# Altium schematic sheet ADC.SchDoc: ESP32 - ANALOG BOARD
size A2; Author: Luca Schenetti; DrawnBy: Luca Schenetti; Revision: B; SheetNumber: 5; SheetTotal: 5
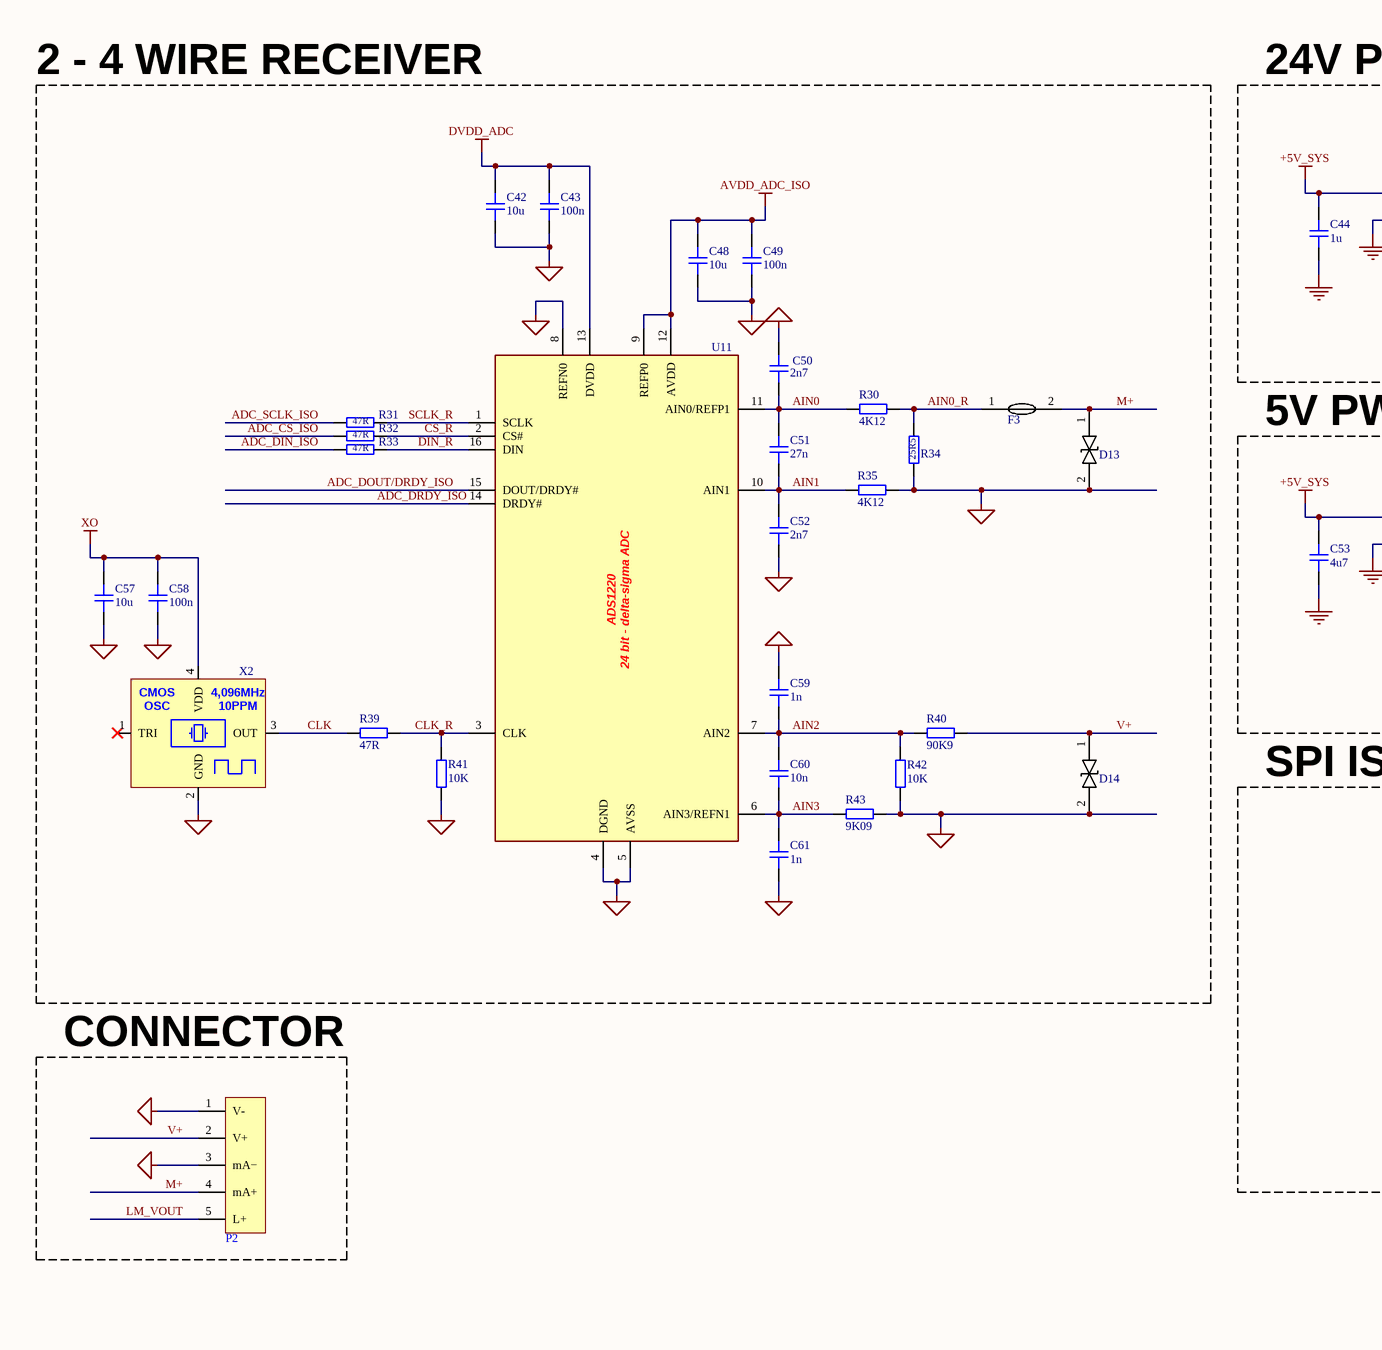
[diagram p0: ADC.SchDoc, left]
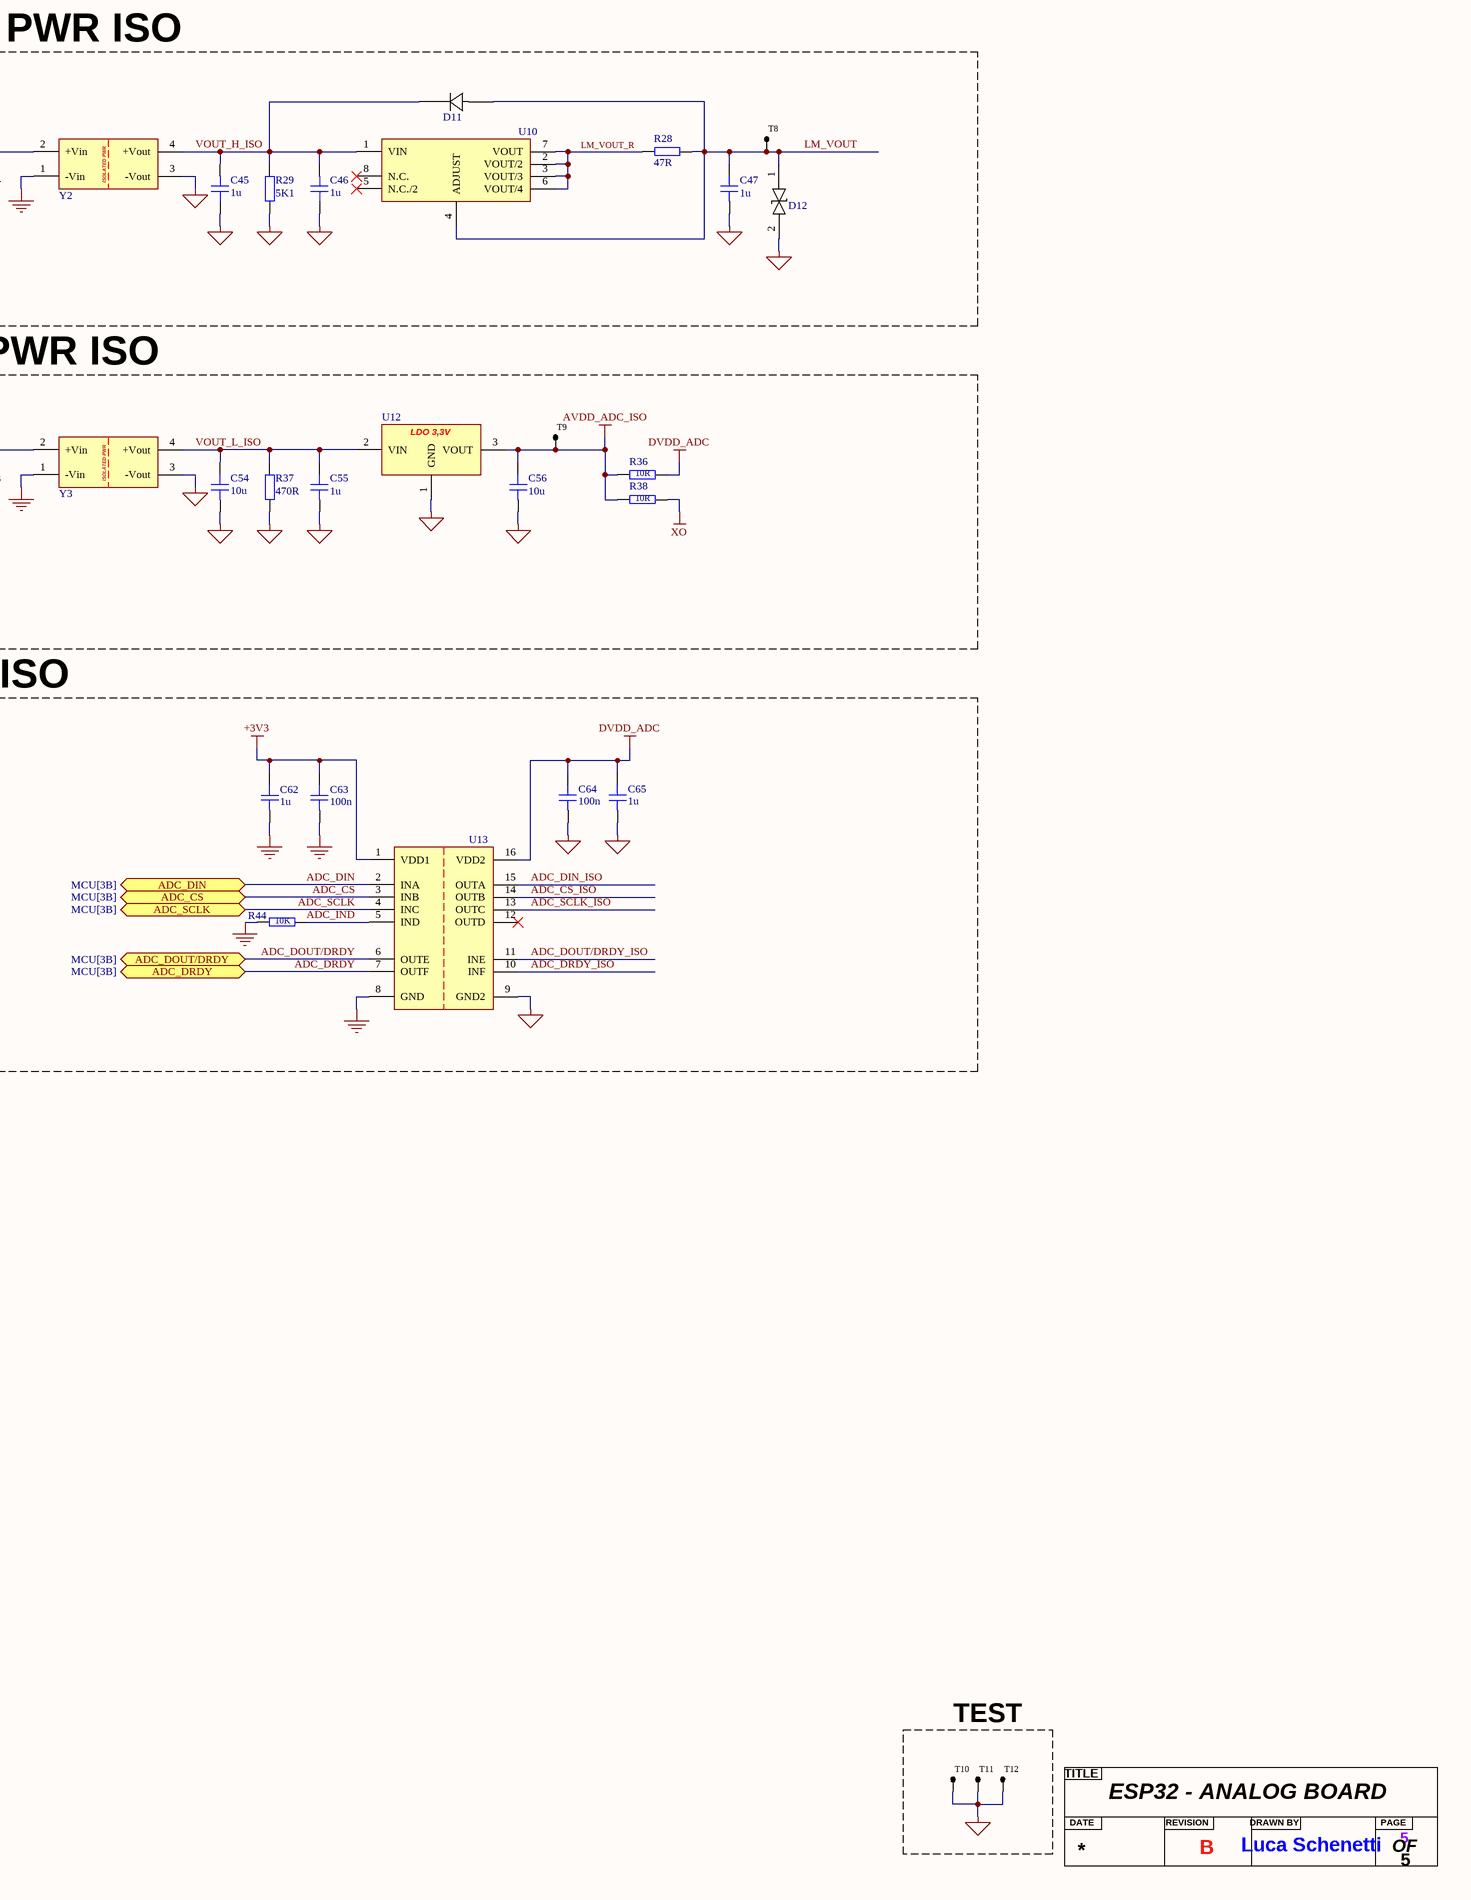
[diagram p1: ADC.SchDoc, right]

## Parts
?  Title  (value not drawn)  (graphical)
C42  10u  [CAP_0402]
C43  100n  [CAP_0402]
C44  1u  [CAP_0805]
C45  1u  [CAP_0805]
C46  1u  [CAP_0805]
C47  1u  [CAP_0805]
C48  10u  [CAP_0402]
C49  100n  [CAP_0402]
C50  2n7  [CAP_0402]
C51  27n  [CAP_0402]
C52  2n7  [CAP_0402]
C53  4u7  [CAP_0805]
C54  10u  [CAP_0805]
C55  1u  [CAP_0603]
C56  10u  [CAP_0603]
C57  10u  [CAP_0402]
C58  100n  [CAP_0402]
C59  1n  [CAP_0402]
C60  10n  [CAP_0402]
C61  1n  [CAP_0402]
C62  1u  [CAP_0402]
C63  100n  [CAP_0402]
C64  100n  [CAP_0402]
C65  1u  [CAP_0402]
D11  DIODE 300mA 75V  [1N4148W]  (value not drawn)
D12  BIDI TVS 36V  [SMAJ33CA]  (value not drawn)
D13  BIDI TVS 36V  [SMAJ33CA]  (value not drawn)
D14  BIDI TVS 36V  [SMAJ33CA]  (value not drawn)
F3  RESETTABLE FUSE 100mA  [BSMD1812-010-60V]  (value not drawn)
P2  WJ500V-5.08-5P  [WJ500V-5.08-5P]  (value not drawn)
R28  47R  [RES_0603]
R29  5K1  [RES_2010]
R30  4K12  [RES_0603]
R31  47R  [RES_0402]
R32  47R  [RES_0402]
R33  47R  [RES_0402]
R34  25R5  [RES_2512]
R35  4K12  [RES_0603]
R36  10R  [RES_0402]
R37  470R  [RES_2010]
R38  10R  [RES_0402]
R39  47R  [RES_0402]
R40  90K9  [RES_0603]
R41  10K  [RES_0402]
R42  10K  [RES_0603]
R43  9K09  [RES_0603]
R44  10K  [RES_0402]
T8  TP_S  [TP 1mm]  (value not drawn)  (no BOM)
T9  TP_S  [TP 1mm]  (value not drawn)  (no BOM)
T10  TP_S  [TP 1mm]  (value not drawn)  (no BOM)
T11  TP_S  [TP 1mm]  (value not drawn)  (no BOM)
T12  TP_S  [TP 1mm]  (value not drawn)  (no BOM)
U10  LDO 100mA 2,2-37V  [LM317LDR2G]  (value not drawn)
U11  ADC 24-Bit 4-Channel  [ADS1220IPWR]  (value not drawn)
U12  LDO 3,3V 250mA  [HT7333-A]  (value not drawn)
U13  Digital Isolators 4 IN - 2 OUT  [NSI8262W1-DSWR]  (value not drawn)
X2  4.096MHz CMOS ±10ppm ±20ppm  [OT32254.096MJBA4SL]  (value not drawn)
Y2  Isolated Power IN 4.5V~5.5V OUT 24V  [B0524S-1WR3]  (value not drawn)
Y3  Isolated Power 21.6V~26.4V  [B0505S-1WR3]  (value not drawn)

## Blocks framed on the sheet
2 - 4 WIRE RECEIVER: C42 C43 C48-C52 C57-C61 D13 D14 F3 R30-R35 R39-R43 U11 X2
24V PWR ISO: C44-C47 D11 D12 R28 R29 T8 U10 Y2
5V PWR ISO: C53-C56 R36-R38 T9 U12 Y3
SPI ISO: C62-C65 R44 U13
CONNECTOR: P2
TEST: T10-T12

## Ports
ADC_CS (bidir, see MCU[3B]), ADC_DIN (bidir, see MCU[3B]), ADC_DOUT/DRDY (bidir, see MCU[3B]), ADC_DRDY (bidir, see MCU[3B]), ADC_SCLK (bidir, see MCU[3B])

## Nets
+3V3: C62.2 C63.2 U13.1(VDD1)
+5V_SYS: C44.2 C53.2 Y2.2(+Vin) Y3.2(+Vin)
AVDD_ADC_ISO: C48.2 C49.2 C56.2 R36.1 R38.1 T9.1 U11.9(REFP0) U11.12(AVDD) U12.3(VOUT)
DVDD_ADC: C42.2 C43.2 C64.2 C65.2 R36.2 U11.13(DVDD) U13.16(VDD2)
GND: C44.1 C53.1 C62.1 C63.1 R44.2 U13.8(GND) Y2.1(-Vin) Y3.1(-Vin)
GND_1: C42.1 C43.1 C45.2 C46.2 C47.1 C48.1 C49.1 C50.2 C52.1 C54.1 C55.1 C56.1 C57.1 C58.1 C59.2 C61.2 C64.1 C65.1 D12.2 D13.2 D14.2 P2.1(V-) P2.3(mA−) R29.1 R34.1 R35.1 R37.1 R41.1 R42.1 R43.1 T10.1 T11.1 T12.1 U11.4(DGND) U11.5(AVSS) U11.8(REFN0) U12.1(GND) U13.9(GND2) X2.2(GND) Y2.3(-Vout) Y3.3(-Vout)
XO: C57.2 C58.2 R38.2 X2.4(VDD)
ADC_CS: U13.3(INB) ; port ADC_CS
ADC_CS_ISO: R32.2 U13.14(OUTB)
ADC_DIN: U13.2(INA) ; port ADC_DIN
ADC_DIN_ISO: R33.2 U13.15(OUTA)
ADC_DOUT/DRDY: U13.6(OUTE) ; port ADC_DOUT/DRDY
ADC_DOUT/DRDY_ISO: U11.15(DOUT/DRDY#) U13.11(INE)
ADC_DRDY: U13.7(OUTF) ; port ADC_DRDY
ADC_DRDY_ISO: U11.14(DRDY#) U13.10(INF)
ADC_IND: R44.1 U13.5(IND)
ADC_SCLK: U13.4(INC) ; port ADC_SCLK
ADC_SCLK_ISO: R31.2 U13.13(OUTC)
AIN0: C50.1 C51.2 R30.2 U11.11(AIN0/REFP1)
AIN0_R: F3.1 R30.1 R34.2
AIN1: C51.1 C52.2 R35.2 U11.10(AIN1)
AIN2: C59.1 C60.2 R40.2 R42.2 U11.7(AIN2)
AIN3: C60.1 C61.1 R43.2 U11.6(AIN3/REFN1)
CLK: R39.2 X2.3(OUT)
CLK_R: R39.1 R41.2 U11.3(CLK)
CS_R: R32.1 U11.2(CS#)
DIN_R: R33.1 U11.16(DIN)
LM_VOUT: C47.2 D11.2(A) D12.1 P2.5(L+) R28.2 T8.1 U10.4(ADJUST)
LM_VOUT_R: R28.1 U10.2(VOUT/2) U10.3(VOUT/3) U10.6(VOUT/4) U10.7(VOUT)
M+: D13.1 F3.2 P2.4(mA+)
SCLK_R: R31.1 U11.1(SCLK)
V+: D14.1 P2.2(V+) R40.1
VOUT_H_ISO: C45.1 C46.1 D11.1(C) R29.2 U10.1(VIN) Y2.4(+Vout)
VOUT_L_ISO: C54.2 C55.2 R37.2 U12.2(VIN) Y3.4(+Vout)

Not connected (* = marked no-connect by the designer): U10 5(N.C./2)* 8(N.C.)*; U13 12(OUTD)*; X2 1(TRI)*

## Notes on the sheet
- (in symbol ADS1220IPWR) ADS1220; 24 bit - delta-sigma ADC
- (in symbol B0505S-1WR3) ISOLATED PWR
- (in symbol B0524S-1WR3) ISOLATED PWR
- (in symbol HT7333-A) LDO 3,3V
- (in symbol OT32254.096MJBA4SL) CMOS; 4,096MHz; OSC; 10PPM
- (in symbol Title) TITLE; DATE; REVISION; DRAWN BY; PAGE; OF

## Library data of the parts
C42 C48 C57 = CAP_0402: [C15525]; Manufacturer: *; Manufacturer Part Number: *; Distributor Link: *; LCSC: *; Rating: *; Dielectric: *
C43 C49 C58 C63 C64 = CAP_0402: [C307331]; Manufacturer: *; Manufacturer Part Number: *; Distributor Link: *; LCSC: *; Rating: *; Dielectric: *
C44-C47 = CAP_0805: [C28323]; Manufacturer: *; Manufacturer Part Number: *; Distributor Link: *; LCSC: *; Rating: *; Dielectric: *
C50 C52 = CAP_0402: [C106251]; Manufacturer: *; Manufacturer Part Number: *; Distributor Link: *; LCSC: *; Rating: *; Dielectric: *
C51 = CAP_0402: [C880636]; Manufacturer: *; Manufacturer Part Number: *; Distributor Link: *; LCSC: *; Rating: *; Dielectric: *
C53 = CAP_0805: [C1779]; Manufacturer: *; Manufacturer Part Number: *; Distributor Link: *; LCSC: *; Rating: *; Dielectric: *
C54 = CAP_0805: [C440198]; Manufacturer: *; Manufacturer Part Number: *; Distributor Link: *; LCSC: *; Rating: *; Dielectric: *
C55 = CAP_0603: [C15849]; Manufacturer: *; Manufacturer Part Number: *; Distributor Link: *; LCSC: *; Rating: *; Dielectric: *
C56 = CAP_0603: [C96446]; Manufacturer: *; Manufacturer Part Number: *; Distributor Link: *; LCSC: *; Rating: *; Dielectric: *
C59 C61 = CAP_0402: [C1523]; Manufacturer: *; Manufacturer Part Number: *; Distributor Link: *; LCSC: *; Rating: *; Dielectric: *
C60 = CAP_0402: [C15195]; Manufacturer: *; Manufacturer Part Number: *; Distributor Link: *; LCSC: *; Rating: *; Dielectric: *
C62 C65 = CAP_0402: [C52923]; Manufacturer: *; Manufacturer Part Number: *; Distributor Link: *; LCSC: *; Rating: *; Dielectric: *
D11 = 1N4148W: [C917030]
D12-D14 = SMAJ33CA: [C19077549]
F3 = BSMD1812-010-60V: [C883137]
P2 = WJ500V-5.08-5P: [C2927513]; Manufacturer: KANGNEX(康奈克斯电气); Symbol: WJ500V-5.08-3P-14-00A; Device: WJ500V-5.08-3P; Add into BOM: yes; Structure: 1x3P; Pitch: 5.08mm; Current Rating (Max): 18A; Voltage Rating (Max): 250V; Wire Gauge - AWG: 14~30; Wire Gauge - mm2: 2.5; Number of PINs Per Row: 3; LCSC Part Name: 5.08mm 1x3P 排数:1 每排P数:3 直插; Supplier Part: C72334; Manufacturer Part: WJ500V-5.08-3P; Supplier Footprint: 插件,P=5.08mm; JLCPCB Part Class: Extended Part; Datasheet: https://atta.szlcsc.com/upload/public/pdf/source/20191225/C72334_8A5EF831D67650233B6B1E3F2BC06274.pdf; Supplier: LCSC; Convert to PCB: yes; Color: Green; Mounting Style: Straight; Number of Pins: 3P; Number of Rows: 1; Operating Temperature Range: -40℃~+105℃
R28 = RES_0603: [C23182]; Manufacturer: *; Manufacturer Part Number: *; Distributor Link: *; LCSC: *
R29 = RES_2010: [C2999618]
R30 R35 = RES_0603: [C23041]; Manufacturer: *; Manufacturer Part Number: *; Distributor Link: *; LCSC: *
R31-R33 R39 = RES_0402: [C25118]; Manufacturer: *; Manufacturer Part Number: *; Distributor Link: *; LCSC: *
R34 = RES_2512: [C2775912]
R36 R38 = RES_0402: [C25077]; Manufacturer: *; Manufacturer Part Number: *; Distributor Link: *; LCSC: *
R37 = RES_2010: [C2933989]
R40 = RES_0603: [C23129]; Manufacturer: *; Manufacturer Part Number: *; Distributor Link: *; LCSC: *
R41 R44 = RES_0402: [C25744]; Manufacturer: *; Manufacturer Part Number: *; Distributor Link: *; LCSC: *
R42 = RES_0603: [C25804]; Manufacturer: *; Manufacturer Part Number: *; Distributor Link: *; LCSC: *
R43 = RES_0603: [C23125]; Manufacturer: *; Manufacturer Part Number: *; Distributor Link: *; LCSC: *
T8-T12 = TP_S: test point
U10 = LM317LDR2G: [C7940]
U11 = ADS1220IPWR: [C48263]
U12 = HT7333-A: [C347191]
U13 = NSI8262W1-DSWR: [C5441133]
X2 = OT32254.096MJBA4SL: [C2831395]
Y2 = B0524S-1WR3: [C7500908]
Y3 = B0505S-1WR3: [C7465178]